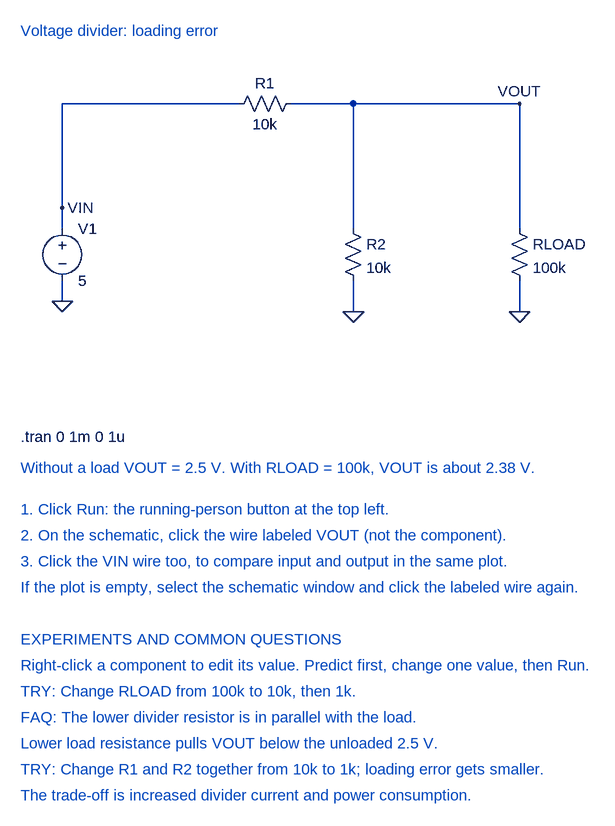
[diagram p0: schematic 11-loaded-voltage-divider.asc]
11-loaded-voltage-divider.asc, the LTspice schematic file:
Version 4
SHEET 1 1200 1400
WIRE 128 304 128 336
WIRE 128 416 128 448
WIRE 128 304 128 144
WIRE 128 144 400 144
WIRE 480 144 832 144
WIRE 576 144 576 336
WIRE 576 416 576 464
WIRE 832 144 832 336
WIRE 832 416 832 464
FLAG 128 304 VIN
FLAG 128 448 0
FLAG 832 144 VOUT
FLAG 576 464 0
FLAG 832 464 0
SYMBOL voltage 128 320 R0
SYMATTR InstName V1
SYMATTR Value 5
SYMBOL res 496 128 R90
WINDOW 0 0 56 VBottom 2
WINDOW 3 32 56 VTop 2
SYMATTR InstName R1
SYMATTR Value 10k
SYMBOL res 560 320 R0
SYMATTR InstName R2
SYMATTR Value 10k
SYMBOL res 816 320 R0
SYMATTR InstName RLOAD
SYMATTR Value 100k
TEXT 64 32 Left 2 ;Voltage divider: loading error
TEXT 64 656 Left 2 !.tran 0 1m 0 1u
TEXT 64 704 Left 2 ;Without a load VOUT = 2.5 V. With RLOAD = 100k, VOUT is about 2.38 V.
TEXT 64 768 Left 2 ;1. Click Run: the running-person button at the top left.
TEXT 64 808 Left 2 ;2. On the schematic, click the wire labeled VOUT (not the component).
TEXT 64 848 Left 2 ;3. Click the VIN wire too, to compare input and output in the same plot.
TEXT 64 888 Left 2 ;If the plot is empty, select the schematic window and click the labeled wire again.
TEXT 64 968 Left 2 ;EXPERIMENTS AND COMMON QUESTIONS
TEXT 64 1008 Left 2 ;Right-click a component to edit its value. Predict first, change one value, then Run.
TEXT 64 1048 Left 2 ;TRY: Change RLOAD from 100k to 10k, then 1k.
TEXT 64 1088 Left 2 ;FAQ: The lower divider resistor is in parallel with the load.
TEXT 64 1128 Left 2 ;Lower load resistance pulls VOUT below the unloaded 2.5 V.
TEXT 64 1168 Left 2 ;TRY: Change R1 and R2 together from 10k to 1k; loading error gets smaller.
TEXT 64 1208 Left 2 ;The trade-off is increased divider current and power consumption.

The netlist it stands for:
* 11-loaded-voltage-divider.asc
V1 VIN 0 5
R1 VOUT VIN 10k
R2 VOUT 0 10k
RLOAD VOUT 0 100k
* Voltage divider: loading error
.tran 0 1m 0 1u
* Without a load VOUT = 2.5 V. With RLOAD = 100k, VOUT is about 2.38 V.
* 1. Click Run: the running-person button at the top left.
* 2. On the schematic, click the wire labeled VOUT (not the component).
* 3. Click the VIN wire too, to compare input and output in the same plot.
* If the plot is empty, select the schematic window and click the labeled wire again.
* EXPERIMENTS AND COMMON QUESTIONS
* Right-click a component to edit its value. Predict first, change one value, then Run.
* TRY: Change RLOAD from 100k to 10k, then 1k.
* FAQ: The lower divider resistor is in parallel with the load.
* Lower load resistance pulls VOUT below the unloaded 2.5 V.
* TRY: Change R1 and R2 together from 10k to 1k; loading error gets smaller.
* The trade-off is increased divider current and power consumption.
.backanno
.end